# Altium schematic sheet Oscillator.SchDoc
size A; SheetNumber: 4; SheetTotal: 4
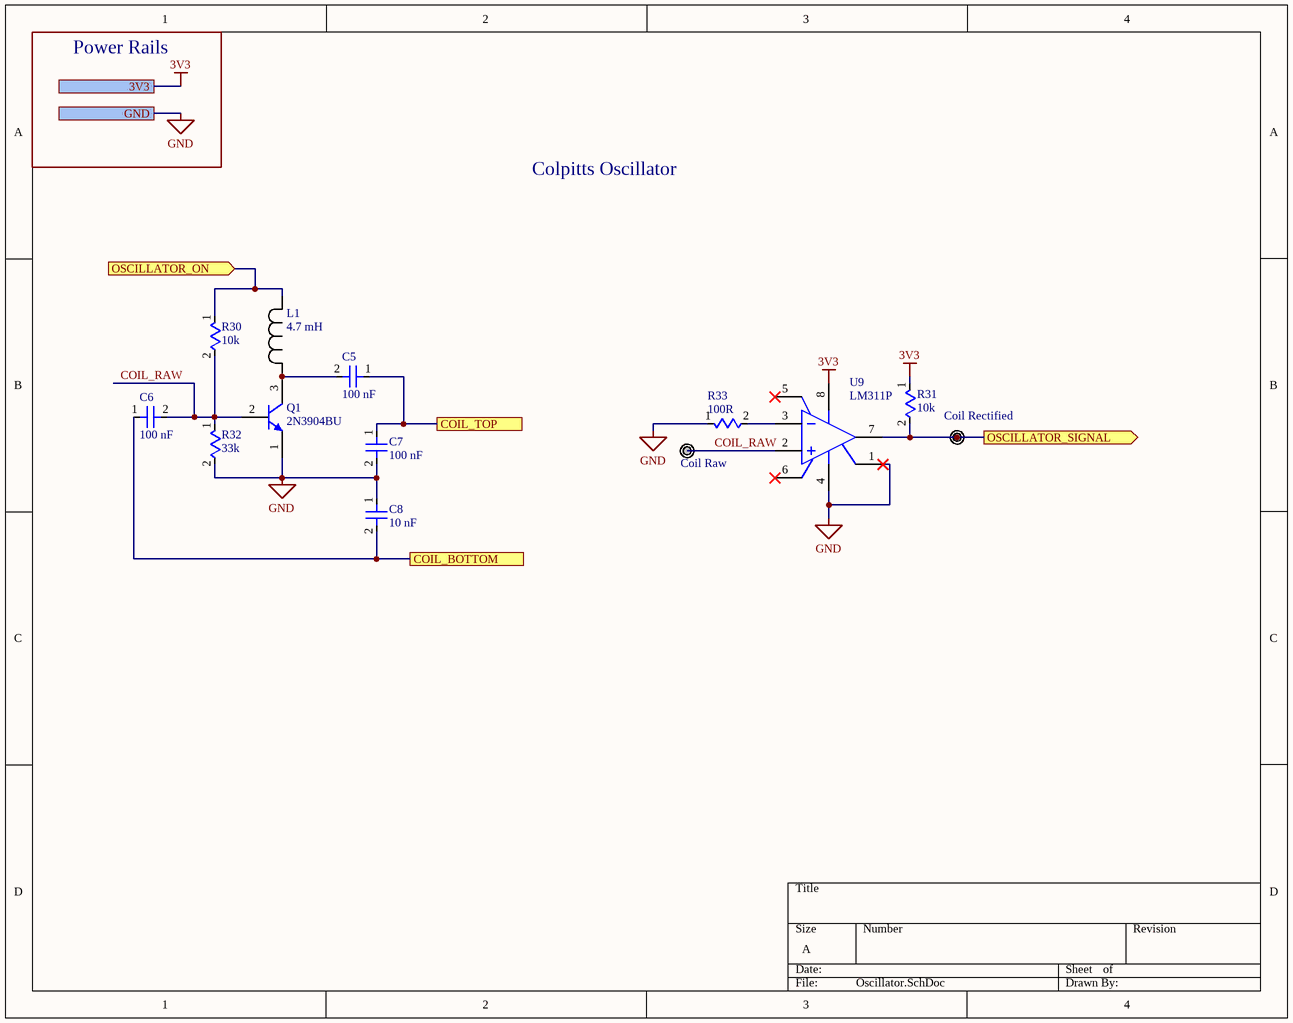
[diagram p0: Oscillator.SchDoc]

## Parts
C5  100 nF  [Generic small capacitor]
C6  100 nF  [Generic small capacitor]
C7  100 nF  [Generic small capacitor]
C8  10 nF  [Generic small capacitor]
L1  4.7 mH  [IND_BOURNS_RLB1014]
Q1  2N3904BU  [2n3904]
R30  10k  [Axial 0.5]
R31  10k  [Axial 0.5]
R32  33k  [Axial 0.5]
R33  100R  [Axial 0.5]
TP4  Coil Rectified  [TESTPOINT]  (no BOM)
TP5  Coil Raw  [TESTPOINT]  (no BOM)
U9  LM311P  [FP-P0008A-MFG]

## Ports
3V3 (see RSM[2A], Beacon Detector[1A], Tape Array[1A]), COIL_BOTTOM (see RSM[2A]), COIL_TOP (see RSM[2A]), GND (see RSM[3A], Beacon Detector[1A], Tape Array[1A]), OSCILLATOR_ON (in, see RSM[3A]), OSCILLATOR_SIGNAL (out, see RSM[3A])

## Nets
3V3: R31.1 U9.8(VCC+) ; port 3V3
GND: C7.2 C8.1 Q1.1(E) R32.2 R33.1 U9.1(EMIT_OUT) U9.4(VCC-) ; port GND
COIL_BOTTOM: C6.1 C8.2 ; port COIL_BOTTOM
COIL_RAW: C6.2 Q1.2(B) R30.2 R32.1 TP5.1(TP) U9.2(IN+)
COIL_TOP: C5.1 C7.1 ; port COIL_TOP
OSCILLATOR_ON: L1.1 R30.1 ; port OSCILLATOR_ON
OSCILLATOR_SIGNAL: R31.2 TP4.1(TP) U9.7(COL_OUT) ; port OSCILLATOR_SIGNAL
NetC5_2: C5.2 L1.2 Q1.3(C)
NetR33_2: R33.2 U9.3(IN-)

Not connected (* = marked no-connect by the designer): U9 5(BALANCE)* 6(BAL/STRB)*

## Notes on the sheet
- Power Rails
- Colpitts Oscillator

## Library data of the parts
C5-C8 = CAP_GENERIC
L1 = RLB1014-472KL: No Description Available; Manufacturer_Name: Bourns Electronics; Copyright: Copyright (C) 2026 Ultra Librarian. All rights reserved.; Manufacturer_Part_Number: RLB1014-472KL
Q1 = 2n3904: NPN General-Purpose Amplifier, 40 V VCEO, 0.2 A, -55 to 150 degC, 2-Pin TO-92, RoHS, Bulk; Manufacturer: FairchildSemiconductor; Maximum Collector Base Voltage: 60V; Minimum DC Current Gain: 40@0.1mA@1V; Maximum Collector Emitter Voltage: 40V; Maximum DC Collector Current: 0.2A; Rad Hard: No; Maximum Operating Frequency: 300(Min)MHz; Maximum Collector Emitter Saturation Voltage: 0.2@1mA@10mA; Maximum Power Dissipation: 625mW; Package Description: 3-Pin Transistor Outline Package, Body Dia 4.79 mm, Pitch 1.27 mm; Package Reference: TO-92; Pin Count: 3; Operating Temperature: -55to150degC; Category: GPBJT; Manufacturer URL: https://www.fairchildsemi.com/; Datasheet URL: https://datasheet.ciiva.com/4722/2n3904-82270-4722369.pdf; Package: 3TO-92; Packaging: Bulk; Type: NPN; Datasheet Version: Rev. 1.1.0, 10/2014; Mounting: ThroughHole
R30-R33 = RES_GENERIC
TP4 TP5 = CMP-020-0000-4: Source: UBC Formula Electric.SchLib; Design Item ID: Thru-Hole Test Point
U9 = CMP-1685-00016-2: Manufacturer Lifecycle Status: ACTIVE; NexarPartId: 24336; Output Type: TTL; Max Output Voltage: 7.5mV; Min Supply Voltage: 3.5V; Min Dual Supply Voltage: 1.75V; Max Supply Current: 7.5mA; Number of Elements: 1; Response Time: 165ns; Max Dual Supply Voltage: 15V; Max Supply Voltage: 30V; Max Junction Temperature (Tj): 150°C; Max Power Dissipation: 500mW; Input Offset Voltage (Vos): 2mV; Resistance: 390Ω; Operating Supply Voltage: 28V; Power Rating: 100mW; Dual Supply Voltage: 9V; Output Current per Channel: 50mA; Turn-On Delay Time: 115ns; Tolerance: 1%; Voltage Gain: 106.02dB; Input Bias Current: 250nA; Voltage Rating: 75V; Contact Plating: Gold; Case Code (Imperial): 0603; Number of Circuits: 1; Lifecycle Status: Production; Ambient Temperature Range High: 70°C; Radiation Hardening: No; Quiescent Current: 7.5mA; Number of Channels: 1; Max Operating Temperature: 70°C; Height: 5.08mm; Type: General Purpose; Case Code (Metric): 1608; Mount: Surface Mount, Through Hole; Case/Package: PDIP; Thickness: 3.9mm; REACH SVHC: No SVHC; Length: 9.81mm; RoHS: Compliant; Schedule B: 8542390000, 8542390000; Lead Free: Lead Free; Min Operating Temperature: 0°C; Width: 6.35mm; Output Current: 50mA; Packaging: Tape and Reel; Nominal Supply Current: 7.5mA; Weight: 2.012816mg; Propagation Delay: 115ns; Max Input Current: 250nA; Number of Pins: 8